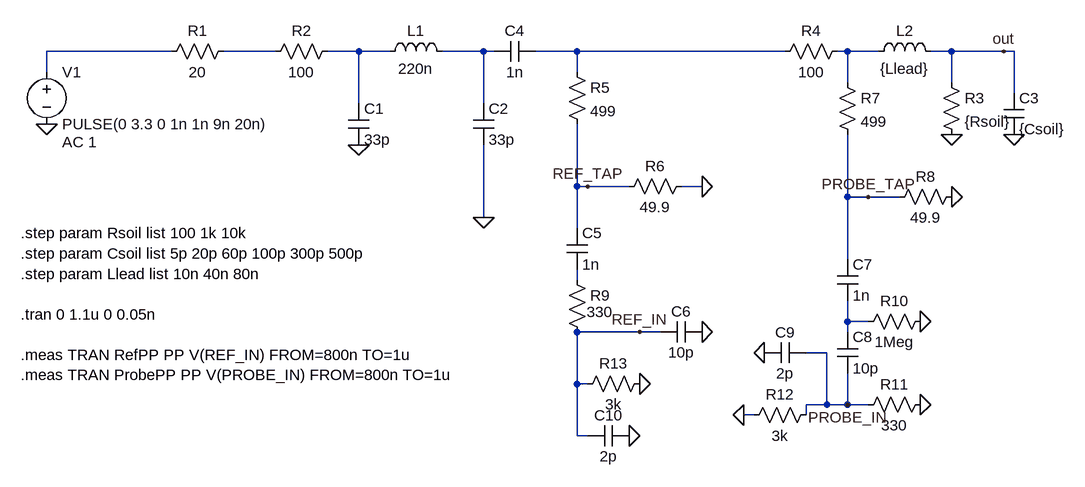
[diagram p0: schematic LCfilter.asc]
LCfilter.asc, the LTspice schematic file:
Version 4.1
SHEET 1 1728 752
WIRE 336 112 144 112
WIRE 496 112 416 112
WIRE 624 112 576 112
WIRE 672 112 624 112
WIRE 816 112 752 112
WIRE 832 112 816 112
WIRE 960 112 896 112
WIRE 1280 112 960 112
WIRE 1376 112 1360 112
WIRE 1424 112 1376 112
WIRE 1536 112 1504 112
WIRE 1616 112 1536 112
WIRE 1632 112 1616 112
WIRE 144 144 144 112
WIRE 960 144 960 112
WIRE 1376 160 1376 112
WIRE 1536 160 1536 112
WIRE 1632 176 1632 112
WIRE 624 192 624 112
WIRE 816 192 816 112
WIRE 960 320 960 224
WIRE 976 320 960 320
WIRE 1040 320 976 320
WIRE 1152 320 1120 320
WIRE 1376 336 1376 240
WIRE 1408 336 1376 336
WIRE 1456 336 1408 336
WIRE 816 368 816 256
WIRE 960 384 960 320
WIRE 1376 432 1376 336
WIRE 960 464 960 448
WIRE 1376 528 1376 496
WIRE 1408 528 1376 528
WIRE 1056 544 960 544
WIRE 1088 544 1056 544
WIRE 1376 544 1376 528
WIRE 1344 576 1312 576
WIRE 960 624 960 544
WIRE 976 624 960 624
WIRE 1344 656 1344 576
WIRE 1344 656 1312 656
WIRE 1376 656 1376 608
WIRE 1376 656 1344 656
WIRE 1408 656 1376 656
WIRE 1232 672 1216 672
WIRE 1312 672 1312 656
WIRE 960 704 960 624
WIRE 976 704 960 704
FLAG 144 224 0
FLAG 624 256 0
FLAG 816 368 0
FLAG 1536 240 0
FLAG 1632 240 0
FLAG 1616 112 out
FLAG 1152 320 0
FLAG 1536 336 0
FLAG 976 320 REF_TAP
FLAG 1408 336 PROBE_TAP
FLAG 1152 544 0
FLAG 1056 544 REF_IN
FLAG 1488 656 0
FLAG 1488 528 0
FLAG 1376 656 PROBE_IN
FLAG 1056 624 0
FLAG 1040 704 0
FLAG 1216 672 0
FLAG 1248 576 0
SYMBOL voltage 144 128 R0
WINDOW 123 24 124 Left 2
WINDOW 39 0 0 Left 0
SYMATTR InstName V1
SYMATTR Value PULSE(0 3.3 0 1n 1n 9n 20n)
SYMATTR Value2 AC 1
SYMBOL res 432 96 R90
WINDOW 0 0 56 VBottom 2
WINDOW 3 32 56 VTop 2
SYMATTR InstName R1
SYMATTR Value 20
SYMBOL res 592 96 R90
WINDOW 0 0 56 VBottom 2
WINDOW 3 32 56 VTop 2
SYMATTR InstName R2
SYMATTR Value 100
SYMBOL ind 656 128 R270
WINDOW 0 32 56 VTop 2
WINDOW 3 5 56 VBottom 2
SYMATTR InstName L1
SYMATTR Value 220n
SYMBOL cap 608 192 R0
SYMATTR InstName C1
SYMATTR Value 33p
SYMBOL cap 800 192 R0
SYMATTR InstName C2
SYMATTR Value 33p
SYMBOL res 1520 144 R0
SYMATTR InstName R3
SYMATTR Value {Rsoil}
SYMBOL cap 1616 176 R0
SYMATTR InstName C3
SYMATTR Value {Csoil}
SYMBOL cap 896 96 R90
WINDOW 0 0 32 VBottom 2
WINDOW 3 32 32 VTop 2
SYMATTR InstName C4
SYMATTR Value 1n
SYMBOL res 1376 96 R90
WINDOW 0 0 56 VBottom 2
WINDOW 3 32 56 VTop 2
SYMATTR InstName R4
SYMATTR Value 100
SYMBOL ind 1408 128 R270
WINDOW 0 32 56 VTop 2
WINDOW 3 5 56 VBottom 2
SYMATTR InstName L2
SYMATTR Value {Llead}
SYMBOL res 944 128 R0
SYMATTR InstName R5
SYMATTR Value 499
SYMBOL res 1136 304 R90
WINDOW 0 0 56 VBottom 2
WINDOW 3 32 56 VTop 2
SYMATTR InstName R6
SYMATTR Value 49.9
SYMBOL res 1360 144 R0
SYMATTR InstName R7
SYMATTR Value 499
SYMBOL res 1552 320 R90
WINDOW 0 0 56 VBottom 2
WINDOW 3 32 56 VTop 2
SYMATTR InstName R8
SYMATTR Value 49.9
SYMBOL cap 944 384 R0
SYMATTR InstName C5
SYMATTR Value 1n
SYMBOL res 944 448 R0
WINDOW 3 31 65 Left 2
SYMATTR InstName R9
SYMATTR Value 330
SYMBOL cap 1152 528 R90
WINDOW 0 0 32 VBottom 2
WINDOW 3 32 32 VTop 2
SYMATTR InstName C6
SYMATTR Value 10p
SYMBOL cap 1360 432 R0
SYMATTR InstName C7
SYMATTR Value 1n
SYMBOL cap 1360 544 R0
SYMATTR InstName C8
SYMATTR Value 10p
SYMBOL res 1504 512 R90
WINDOW 0 0 56 VBottom 2
WINDOW 3 32 56 VTop 2
SYMATTR InstName R10
SYMATTR Value 1Meg
SYMBOL res 1504 640 R90
WINDOW 0 0 56 VBottom 2
WINDOW 3 32 56 VTop 2
SYMATTR InstName R11
SYMATTR Value 330
SYMBOL res 1328 656 R90
WINDOW 0 0 56 VBottom 2
WINDOW 3 32 56 VTop 2
SYMATTR InstName R12
SYMATTR Value 3k
SYMBOL res 1072 608 R90
WINDOW 0 0 56 VBottom 2
WINDOW 3 32 56 VTop 2
SYMATTR InstName R13
SYMATTR Value 3k
SYMBOL cap 1312 560 R90
WINDOW 0 0 32 VBottom 2
WINDOW 3 32 32 VTop 2
SYMATTR InstName C9
SYMATTR Value 2p
SYMBOL cap 1040 688 R90
WINDOW 0 0 32 VBottom 2
WINDOW 3 32 32 VTop 2
SYMATTR InstName C10
SYMATTR Value 2p
TEXT 104 392 Left 2 !.step param Rsoil list 100 1k 10k\n.step param Csoil list 5p 20p 60p 100p 300p 500p\n.step param Llead list 10n 40n 80n\n \n.tran 0 1.1u 0 0.05n\n \n.meas TRAN RefPP PP V(REF_IN) FROM=800n TO=1u\n.meas TRAN ProbePP PP V(PROBE_IN) FROM=800n TO=1u

The netlist it stands for:
* LCfilter.asc
V1 N001 0 PULSE(0 3.3 0 1n 1n 9n 20n) AC 1
R1 N002 N001 20
R2 N003 N002 100
L1 N003 N004 220n
C1 N003 0 33p
C2 N004 0 33p
R3 out 0 {Rsoil}
C3 out 0 {Csoil}
C4 N005 N004 1n
R4 N006 N005 100
L2 N006 out {Llead}
R5 N005 REF_TAP 499
R6 0 REF_TAP 49.9
R7 N006 PROBE_TAP 499
R8 0 PROBE_TAP 49.9
C5 REF_TAP N007 1n
R9 N007 REF_IN 330
C6 0 REF_IN 10p
C7 PROBE_TAP N008 1n
C8 N008 PROBE_IN 10p
R10 0 N008 1Meg
R11 0 PROBE_IN 330
R12 PROBE_IN 0 3k
R13 0 REF_IN 3k
C9 PROBE_IN 0 2p
C10 0 REF_IN 2p
.step param Rsoil list 100 1k 10k
.step param Csoil list 5p 20p 60p 100p 300p 500p
.step param Llead list 10n 40n 80n
.tran 0 1.1u 0 0.05n
.meas TRAN RefPP PP V(REF_IN) FROM=800n TO=1u
.meas TRAN ProbePP PP V(PROBE_IN) FROM=800n TO=1u
.backanno
.end